# Altium schematic sheet Connector_Section.SchDoc
size A4; DocumentNumber: 21; SheetNumber: 21; SheetTotal: 28
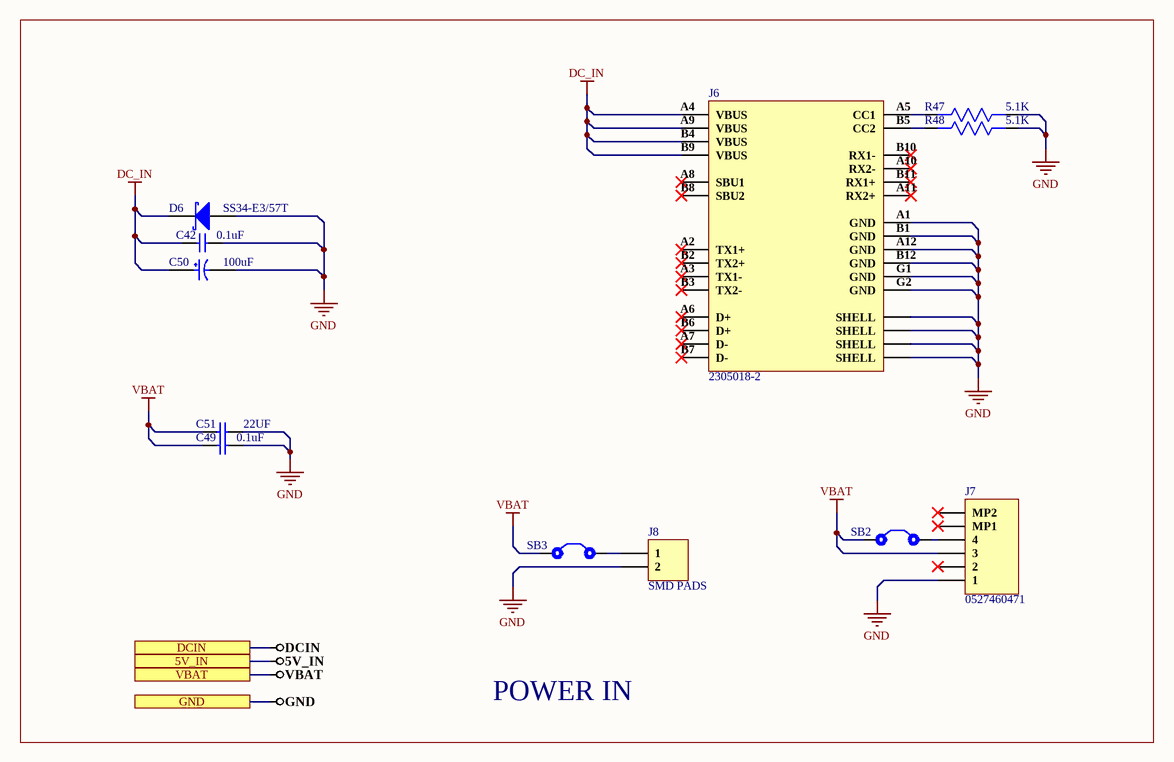
[diagram p0: Connector_Section.SchDoc]

## Parts
C42  0.1uF  [Cap0603]
C49  0.1uF  [Cap0603]
C50  100uF  [593D107X9016D2TE3]
C51  22UF  [Cap0805]
D6  SS34-E3/57T  [SMC]
J6  2305018-2  [2305018-2]
J7  0527460471  [0527460471]
J8  SMD PADS  [SMD PAD]
R47  5.1K  [Res0603]
R48  5.1K  [Res0603]
SB2  Solder Bridge  [Solder Bridge]  (value not drawn)
SB3  Solder Bridge  [Solder Bridge]  (value not drawn)

## Blocks framed on the sheet
POWER IN: C42 C49-C51 D6 J6-J8 R47 R48 SB2 SB3

## Ports
5V_IN, DCIN, GND, VBAT

## Nets
5V_IN: port 5V_IN
DC_IN: C42.1 C50.1 D6.1(K) J6.A4(VBUS) J6.A9(VBUS) J6.B4(VBUS) J6.B9(VBUS)
DCIN: port DCIN
GND: C42.2 C49.2 C50.2 C51.2 D6.2(A) J6.A1(GND) J6.A12(GND) J6.B1(GND) J6.B12(GND) J6.G1(GND) J6.G2(GND) J6.S1(SHELL) J6.S2(SHELL) J6.S3(SHELL) J6.S4(SHELL) J7.1 J8.2 R47.1 R48.1 ; port GND
VBAT: C49.1 C51.1 J7.3 SB2.1 SB3.1 ; port VBAT
NetJ6_A5: J6.A5(CC1) R47.2
NetJ6_B5: J6.B5(CC2) R48.2
NetJ7_4: J7.4 SB2.2
NetJ8_1: J8.1 SB3.2

Not connected (* = marked no-connect by the designer): J6 A2(TX1+)* A3(TX1-)* A6(D+)* A7(D-)* A8(SBU1)* A10(RX2-)* A11(RX2+)* B2(TX2+)* B3(TX2-)* B6(D+)* B7(D-)* B8(SBU2)* B10(RX1-)* B11(RX1+)*; J7 2* MP1* MP2*

## Library data of the parts
C42 C49 = CC0603ZRY5V9BB104: CAP CER 0.1UF 50V Y5V 0603; Manufacturer: Yageo; Capacitance: 100nF; Tolerance: 80%; Supplier 1: Digi-Key; Manufacturer Part Number: CC0603ZRY5V9BB104; Stock 1: 15000880; Pricing 1: 1=0.1, 10=0.075, 100=0.0334, 500=0.02386, 1000=0.01874 (USD); Mount: Surface Mount; Case/Package: 0603; Number of Pins: 2; Case Code (Metric): 1608; Case Code (Imperial): 0603; Min Operating Temperature: -30°C; Max Operating Temperature: 85°C; Dielectric: Y5V; Voltage Rating: 50V; Package Quantity: 1; Packaging: Tape and Reel; Voltage Rating (DC): 50V; Termination: SMD/SMT; Composition: Ceramic; Voltage: 50V; Length: 1.6mm; Height: 0.8mm; Width: 0.031inch; Thickness: 0.035inch; Depth: 0.8mm; Radiation Hardening: No; REACH SVHC: No SVHC; Lead Free: Lead Free; Halogen Free: Halogen Free; ComponentLink1URL: http://www.yageo.com/documents/recent/UPY-GPHC_Y5V_6.3V-to-50V_8.pdf?src-supplier=Digi-Key; ComponentLink1Description: http://www.yageo.com/documents/recent/UPY-GPHC_Y5V_6.3V-to-50V_8.pdf?src-supplier=Digi-Key; ComponentLink2URL: http://www.yageo.com/documents/recent/UPY-GPHC_Y5V_6.3V-to-50V_5.pdf?src-supplier=Avnet+Europe; ComponentLink2Description: http://www.yageo.com/documents/recent/UPY-GPHC_Y5V_6.3V-to-50V_5.pdf?src-supplier=Avnet+Europe; ComponentLink3URL: https://www.verical.com/server-webapp/html/getDatasheet?partID=403611&src-supplier=Verical; ComponentLink3Description: https://www.verical.com/server-webapp/html/getDatasheet?partID=403611&src-supplier=Verical; ComponentLink4URL: http://www.mouser.com/ds/2/447/Yageo_UPY-GP_NP0_16V-to-50V_9-358835.pdf?src-supplier=Mouser; ComponentLink4Description: http://www.mouser.com/ds/2/447/Yageo_UPY-GP_NP0_16V-to-50V_9-358835.pdf?src-supplier=Mouser; ComponentLink5URL: http://www.farnell.com/datasheets/1132289.pdf?src-supplier=Element14; ComponentLink5Description: http://www.farnell.com/datasheets/1132289.pdf?src-supplier=Element14; Supplier Part Number 1: 311-1343-1-ND
C50 = 593D107X9016D2TE3: CAP TANT 100UF 10% 16V 2917; Manufacturer: Vishay Sprague; Tolerance: 20%; ESR (Equivalent Series Resistance): 125mR; Ripple Current: 1.1mA; Leakage Current: 16uA; Polarity: Polar; Dissipation Factor: 8%; Supplier 1: Digi-Key; Manufacturer Part Number: 593D107X9016D2TE3; Stock 1: 7834; Pricing 1: 1=0.99, 10=0.783, 100=0.5874 (USD); Mount: Surface Mount,PCB; Case/Package: 2917; Number of Pins: 2; Weight: 0.023634oz; Case Code (Metric): 7343; Case Code (Imperial): 2917; Min Operating Temperature: -55°C; Max Operating Temperature: 125°C; Capacitance: 100uF; Packaging: Tape and Reel; Voltage Rating: 16V; Package Quantity: 1; Voltage Rating (DC): 16V; Termination: SMD/SMT; Voltage: 16V; Features: General Purpose; Length: 7.3mm; Height: 2.8mm; Depth: 4.3mm; Width: 0.169inch; Height - Seated (Max): 0.122inch; Radiation Hardening: No; REACH SVHC: Unknown; Lead Free: Lead Free; ComponentLink1URL: http://www.vishay.com/docs/40005/593d.pdf?src-supplier=Avnet; ComponentLink1Description: http://www.vishay.com/docs/40005/593d.pdf?src-supplier=Avnet; ComponentLink2URL: http://documents.rs-components.com/techlib://itc_doclist_GB.htm?stockno=6844477&src-supplier=RSComponents; ComponentLink2Description: http://documents.rs-components.com/techlib://itc_doclist_GB.htm?stockno=6844477&src-supplier=RSComponents; ComponentLink3URL: http://www.vishay.com/docs/40005/593d.pdf?src-supplier=Avnet+Europe; ComponentLink3Description: http://www.vishay.com/docs/40005/593d.pdf?src-supplier=Avnet+Europe; ComponentLink4URL: http://www.vishay.com/docs/40005/593d.pdf?src-supplier=Digi-Key; ComponentLink4Description: http://www.vishay.com/docs/40005/593d.pdf?src-supplier=Digi-Key; ComponentLink5URL: http://www.mouser.com/ds/2/427/593d-239975.pdf?src-supplier=Mouser; ComponentLink5Description: http://www.mouser.com/ds/2/427/593d-239975.pdf?src-supplier=Mouser; ComponentLink6URL: https://www.alliedelec.com/m/d/4999163682384315a74ef22064734d6b.pdf?src-supplier=Allied+Electronics; ComponentLink6Description: https://www.alliedelec.com/m/d/4999163682384315a74ef22064734d6b.pdf?src-supplier=Allied+Electronics; Supplier Part Number 1: 718-1102-1-ND
C51 = C2012X5R1E226M125AC: CAP CER 22UF 25V X5R 0805
D6 = SS34-E3/57T: DIODE SCHOTTKY 40V 3A DO214AB; Manufacturer: Vishay Semiconductors; Max Reverse Current: 500uA; Element Configuration: Single; Max Forward Surge Current (Ifsm): 100A; Polarity: Standard; Forward Voltage: 500mV; Supplier 1: Avnet; Manufacturer Part Number: SS34-E3/57T; RoHS: Yes; Category: Rectifier Diodes; Stock 1: 850; Pricing 1: 850=0.23754, 1700=0.19495, 3400=0.19341, 5100=0.19188, 6800=0.19034, 8500=0.18881, 85000=0.18727 (USD); Mount: Surface Mount; Case/Package: SMC; Number of Pins: 2; Contact Plating: Tin,Matte; Min Operating Temperature: -55°C; Max Operating Temperature: 125°C; Packaging: Tape and Reel; Forward Current: 3A; Max Repetitive Reverse Voltage (Vrrm): 40V; Voltage Rating (DC): 40V; Current Rating: 3A; Output Current: 3A; Max Surge Current: 100A; Package Quantity: 1; Average Rectified Current: 3A; Max Reverse Leakage Current: 500uA; Peak Non-Repetitive Surge Current: 100A; Max Reverse Voltage (DC): 40V; Current: 3A; Voltage: 40V; Length: 7.11mm; Width: 6.22mm; Height: 2.417mm; Radiation Hardening: No; Lead Free: Lead Free; REACH SVHC: Unknown; Supplier Part Number 1: SS34-E3/57T
J6 = 2305018-2: CONN RCP USB3.1 TYPEC 24P SMD RA; Manufacturer: TE Connectivity AMP; Connector Type: USB; Number of Contacts: 24; Gender: Receptacle; Number of Ports: 1; Current Rating: 1.25A; Voltage Rating: 30V; Shielding: Shielded; Ratings: Waterproof; Supplier 1: Digi-Key; Manufacturer Part Number: 2305018-2; RoHS: Yes; Category: USB Connectors; Stock 1: 4590; Pricing 1: 1=3.00000, 10=2.87800, 25=2.63840, 50=2.51840, 100=2.39840, 250=2.09864 (USD); Mount: Surface Mount,Through Hole; Contact Plating: Gold; Insulation Color: Black; Min Operating Temperature: -40°C; Max Operating Temperature: 85°C; Packaging: Tape and Reel; Termination: Solder; Flammability Rating: UL94 V-0; RoHS Compliant: Yes; ComponentLink1URL: http://www.farnell.com/datasheets/2611889.pdf?src-supplier=Farnell; ComponentLink1Description: http://www.farnell.com/datasheets/2611889.pdf?src-supplier=Farnell; ComponentLink2URL: https://www.te.com/commerce/DocumentDelivery/DDEController?Action=srchrtrv&DocNm=2305018&DocType=Customer+Drawing&DocLang=English&src-supplier=Digi-Key; ComponentLink2Description: https://www.te.com/commerce/DocumentDelivery/DDEController?Action=srchrtrv&DocNm=2305018&DocType=Customer+Drawing&DocLang=English&src-supplier=Digi-Key; ComponentLink3URL: http://www.farnell.com/datasheets/2611889.pdf?src-supplier=Newark; ComponentLink3Description: http://www.farnell.com/datasheets/2611889.pdf?src-supplier=Newark; Supplier Part Number 1: A132569CT-ND
J7 = 0527460471: CONN FFC BOTTOM 4POS 0.50MM R/A; Manufacturer: Molex; Manufacturer Part Number: 52746-0471; Actuator Material: Glass,Polyphenylene; Actuator Color: Brown; Current Rating: 500mA; Voltage Rating: 50V; Number of Positions: 4; Wire/Cable Type: Straight; Contact Resistance: 20mR; Mating Cycles: 20; Gender: Receptacle; Pitch: 0.5mm; Supplier 1: Digi-Key; RoHS: Yes; Category: FFC / FPC; Stock 1: 213; Pricing 1: 1=0.76000, 10=0.64000, 100=0.49810 (USD); Mount: Surface Mount; Contact Material: Bronze; Contact Plating: Gold; Housing Material: Nylon; Housing Color: Natural; Min Operating Temperature: -20°C; Max Operating Temperature: 85°C; Packaging: Tape and Reel; Termination: Solder; Package Quantity: 1; Number of Rows: 1; Number of Contacts: 4; Orientation: Right Angle; Series: Easy-On™ 52746; Contact Location: Bottom; Length: 8.1mm; Depth: 4.3mm; Radiation Hardening: No; Flammability Rating: UL94 V-0; REACH SVHC: Unknown; RoHS Compliant: Yes; ComponentLink1URL: https://datasheet.ciiva.com/8038/1597791-8038563.pdf?src-supplier=Element14; ComponentLink1Description: https://datasheet.ciiva.com/8038/1597791-8038563.pdf?src-supplier=Element14; ComponentLink2URL: https://datasheet.ciiva.com/11745/0900766b80dfdcc6-11745365.pdf?src-supplier=RSComponents; ComponentLink2Description: https://datasheet.ciiva.com/11745/0900766b80dfdcc6-11745365.pdf?src-supplier=RSComponents; ComponentLink3URL: https://datasheet.ciiva.com/15176/getdatasheetpartid-367391-15176714.pdf?src-supplier=Verical; ComponentLink3Description: https://datasheet.ciiva.com/15176/getdatasheetpartid-367391-15176714.pdf?src-supplier=Verical; Supplier Part Number 1: WM6768CT-ND
J8 = SMD PAD
R47 R48 = RC0603JR-075K1L: RES SMD 5.1K OHM 5% 1/10W 0603; Manufacturer: Yageo; Resistance: 5.1kR; Power Rating: 100mW; Voltage Rating: 50V; Temperature Coefficient: 100ppm/°C; Supplier 1: Digi-Key; Manufacturer Part Number: RC0603JR-075K1L; RoHS: Yes; Category: Chip SMD Resistors; Stock 1: 410681; Pricing 1: 1=0.10000, 10=0.02000, 100=0.00800, 1000=0.00360, 2500=0.00312 (USD); Case/Package: 0603; Number of Pins: 2; Case Code (Imperial): 0603; Case Code (Metric): 1608; Size Code: 0603; Min Operating Temperature: -55°C; Max Operating Temperature: 155°C; Tolerance: 5%; Packaging: Tape and Reel; Termination: SMD/SMT; Resistor Type: Thick Film; Voltage Rating (DC): 50V; Features: Moisture Resistant; Series: RC; Max Power Dissipation: 100mW; Number of Terminations: 2; Resistance Tolerance: 5%; Construction: Rectangular; Length: 1.6mm; Depth: 0.8mm; REACH SVHC: No SVHC; Military Standard: Not; Lead Free: Lead Free; RoHS Compliant: Yes; ComponentLink1URL: http://www.mouser.com/ds/2/447/RC0603-272842.pdf?src-supplier=Mouser; ComponentLink1Description: http://www.mouser.com/ds/2/447/RC0603-272842.pdf?src-supplier=Mouser; ComponentLink2URL: http://components.arrow.com/part/dataview/0323_00047491?src-supplier=Arrow+Europe; ComponentLink2Description: http://components.arrow.com/part/dataview/0323_00047491?src-supplier=Arrow+Europe; ComponentLink3URL: http://www.farnell.com/datasheets/2167052.pdf?src-supplier=Farnell; ComponentLink3Description: http://www.farnell.com/datasheets/2167052.pdf?src-supplier=Farnell; ComponentLink4URL: http://www.farnell.com/datasheets/2167052.pdf?src-supplier=Element14; ComponentLink4Description: http://www.farnell.com/datasheets/2167052.pdf?src-supplier=Element14; ComponentLink5URL: http://www.farnell.com/datasheets/2167052.pdf?src-supplier=Newark; ComponentLink5Description: http://www.farnell.com/datasheets/2167052.pdf?src-supplier=Newark; ComponentLink6URL: http://www.farnell.com/datasheets/1868787.pdf?src-supplier=Newark; ComponentLink6Description: http://www.farnell.com/datasheets/1868787.pdf?src-supplier=Newark; ComponentLink7URL: http://www.yageo.com/documents/recent/PYu-RC_Group_51_RoHS_L_10.pdf?src-supplier=Digi-Key; ComponentLink7Description: http://www.yageo.com/documents/recent/PYu-RC_Group_51_RoHS_L_10.pdf?src-supplier=Digi-Key; ComponentLink8URL: http://www.yageo.com/documents/recent/PYu-RC0603_51_RoHS_L_7.pdf?src-supplier=Future+Electronics; ComponentLink8Description: http://www.yageo.com/documents/recent/PYu-RC0603_51_RoHS_L_7.pdf?src-supplier=Future+Electronics; Supplier Part Number 1: 311-5.1KGRCT-ND
SB2 SB3 = Solder Bridge: Solder Bridge ON